# Altium schematic sheet ffultra_p2_pre-channel.SchDoc
size A4; SheetNumber: 11; SheetTotal: 12
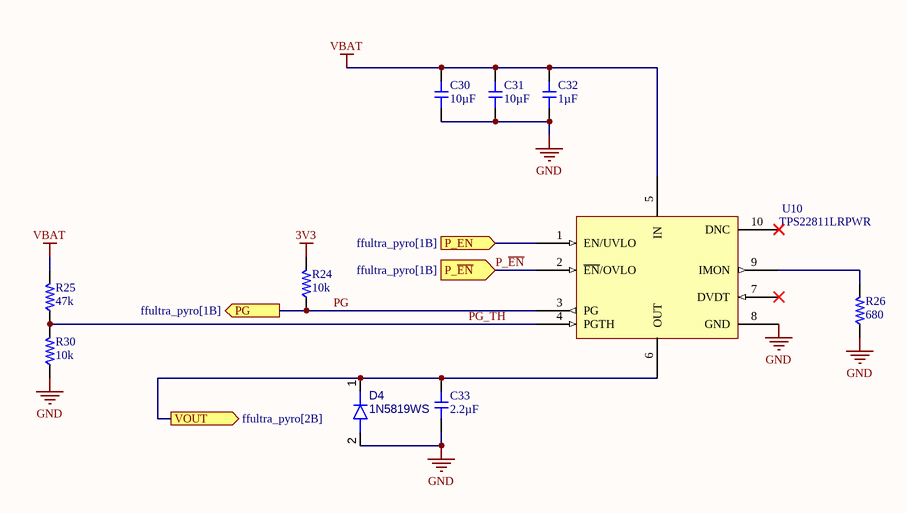
[diagram p0: ffultra_p2_pre-channel.SchDoc]

## Parts
C30  value 10µF  [CAP-0402]  (hidden comment: GRM155R61A106ME44D)
C31  value 10µF  [CAP-0402]  (hidden comment: GRM155R61A106ME44D)
C32  value 1µF  [CAP-0402]  (hidden comment: CL05A105KA5NQNC)
C33  value 2.2µF  [CAP-0402]  (hidden comment: CL05A225MQ5NSNC)
D4  1N5819WS  [FP-477-02-IPC_C]
R24  value 10k  [RES-0402]  (hidden comment: 0402WGF1002TCE)
R25  value 47k  [RES-0402]  (hidden comment: 0402WGF4702TCE)
R26  value 680  [RES-0402]  (hidden comment: 0402WGF6800TCE)
R30  value 10k  [RES-0402]  (hidden comment: 0402WGF1002TCE)
U10  TPS22811LRPWR  [TPS22811LRPWR-Footprint-1]

## Ports
P_EN (in, see ffultra_pyro[1B]), P_~{EN} (in, see ffultra_pyro[1B]), PG (out, see ffultra_pyro[1B]), VOUT (out, see ffultra_pyro[2B])

## Nets
3V3: R24.2
GND: C30.2 C31.2 C32.1 C33.1 D4.2(A) R26.1 R30.1 U10.8(GND)
VBAT: C30.1 C31.1 C32.2 R25.2 U10.5(IN)
P_~{EN}: U10.2(~{EN}/OVLO) ; port P_~{EN}
P_EN: U10.1(EN/UVLO) ; port P_EN
PG: R24.1 U10.3(PG) ; port PG
PG_TH: R25.1 R30.2 U10.4(PGTH)
VOUT: C33.2 D4.1(K) U10.6(OUT) ; port VOUT
NetR26_2: R26.2 U10.9(IMON)

Not connected (* = marked no-connect by the designer): U10 7(DVDT)* 10(DNC)*

## Library data of the parts
C30 C31 = CMP-001-01770-1: Capacitor, Ceramic (MLCC), 10uF, ±20%, 10V, X5R, ±20%, SMD 0402; Manufacturer: Murata Electronics; Manufacturer Part Number: GRM155R61A106ME44D; ComponentLink3URL: https://lcsc.com/product-detail/Multilayer-Ceramic-Capacitors-MLCC---SMD-SMT_Murata-Electronics-Murata-Electronics-GRM155R61A106ME44D_C77000.html; Case/Package: 0402; Category: Capacitors - MLCC; Design Item ID: GRM155R61A106ME44D; JLCPCB Part Number: C77000; Source: jlcpcb_capacitors_extended_0402.schlib; ComponentLink2URL: https://jlcpcb.com/partdetail/C77000; Temperature Coefficient: X5R; ComponentLink3Description: LCSC Part URL; Tolerance: 20%; RoHS: Yes; JLCPCB Basic Part: No; ComponentLink2Description: JLCPCB Part URL; Voltage Rating: 10V; ComponentLink1Description: Datasheet; ComponentLink1URL: https://datasheet.lcsc.com/lcsc/1811141510_Murata-Electronics-GRM155R61A106ME44D_C77000.pdf
C32 = CMP-001-00135-1: Capacitor, Ceramic (MLCC), 1uF, ±10%, 25V, X5R, ±10%, SMD 0402; Manufacturer: Samsung Electro-Mechanics; Voltage Rating: 25V; RoHS: Yes; Temperature Coefficient: X5R; Tolerance: 10%; Source: jlcpcb_capacitors_basic.schlib; ComponentLink1URL: https://datasheet.lcsc.com/lcsc/1811091611_Samsung-Electro-Mechanics-CL05A105KA5NQNC_C52923.pdf; JLCPCB Basic Part: Yes; ComponentLink1Description: Datasheet; ComponentLink2URL: https://jlcpcb.com/partdetail/C52923; Case/Package: 0402; ComponentLink3Description: LCSC Part URL; Manufacturer Part Number: CL05A105KA5NQNC; ComponentLink3URL: https://lcsc.com/product-detail/Multilayer-Ceramic-Capacitors-MLCC---SMD-SMT_Samsung-Electro-Mechanics-Samsung-Electro-Mechanics-CL05A105KA5NQNC_C52923.html; Design Item ID: CL05A105KA5NQNC; JLCPCB Part Number: C52923; ComponentLink2Description: JLCPCB Part URL; Category: Capacitors - MLCC
C33 = CMP-001-00137-1: Capacitor, Ceramic (MLCC), 2.2uF, ±20%, 6.3V, X5R, ±20%, SMD 0402; Manufacturer: Samsung Electro-Mechanics; Voltage Rating: 6.3V; ComponentLink3Description: LCSC Part URL; JLCPCB Basic Part: Yes; JLCPCB Part Number: C12530; ComponentLink1URL: https://datasheet.lcsc.com/lcsc/1811021410_Samsung-Electro-Mechanics-CL05A225MQ5NSNC_C12530.pdf; Tolerance: 20%; Category: Capacitors - MLCC; Source: jlcpcb_capacitors_basic.schlib; ComponentLink2URL: https://jlcpcb.com/partdetail/C12530; ComponentLink3URL: https://lcsc.com/product-detail/Multilayer-Ceramic-Capacitors-MLCC---SMD-SMT_Samsung-Electro-Mechanics-Samsung-Electro-Mechanics-CL05A225MQ5NSNC_C12530.html; ComponentLink2Description: JLCPCB Part URL; Manufacturer Part Number: CL05A225MQ5NSNC; Temperature Coefficient: X5R; RoHS: Yes; ComponentLink1Description: Datasheet; Design Item ID: CL05A225MQ5NSNC; Case/Package: 0402
D4 = CMP-004-00036-1: 40V 600mV@1A 1A SOD-323  Schottky Barrier Diodes (SBD) ROHS; JLCPCB Part Number: C191023
R24 R30 = CMP-009-00191-1: Resistor, 10kΩ, ±1%, 62.5mW, 50V, ±100ppm/℃, -55℃~+155℃, SMD 0402; Manufacturer: Uniroyal; Temperature Rating: -55℃~+155℃; ComponentLink1URL: https://datasheet.lcsc.com/lcsc/2206010100_UNI-ROYAL-Uniroyal-Elec-0402WGF1002TCE_C25744.pdf; Source: jlcpcb_resistors_basic.schlib; Tolerance: 1%; Design Item ID: 0402WGF1002TCE; ComponentLink1Description: Datasheet; ComponentLink2URL: https://jlcpcb.com/partdetail/C25744; Category: Resistors; JLCPCB Part Number: C25744; ComponentLink2Description: JLCPCB Part URL; Temperature Coefficient: ±100ppm/℃; JLCPCB Basic Part: Yes; Power Rating: 62.5mW; Case/Package: 0402; Voltage Rating: 50V; Manufacturer Part Number: 0402WGF1002TCE
R25 = CMP-009-00229-1: Resistor, 47kΩ, ±1%, 62.5mW, 50V, ±100ppm/℃, -55℃~+155℃, SMD 0402; Manufacturer: Uniroyal; Voltage Rating: 50V; ComponentLink2URL: https://jlcpcb.com/partdetail/C25792; ComponentLink1Description: Datasheet; Design Item ID: 0402WGF4702TCE; JLCPCB Part Number: C25792; Tolerance: 1%; Power Rating: 62.5mW; Temperature Coefficient: ±100ppm/℃; Temperature Rating: -55℃~+155℃; ComponentLink2Description: JLCPCB Part URL; Source: jlcpcb_resistors_basic.schlib; Case/Package: 0402; ComponentLink1URL: https://datasheet.lcsc.com/lcsc/2206010100_UNI-ROYAL-Uniroyal-Elec-0402WGF4702TCE_C25792.pdf; JLCPCB Basic Part: Yes; Manufacturer Part Number: 0402WGF4702TCE; Category: Resistors
R26 = CMP-009-00241-1: Resistor, 680Ω, ±1%, 62.5mW, 50V, ±100ppm/℃, -55℃~+155℃, SMD 0402; Manufacturer: Uniroyal; ComponentLink1Description: Datasheet; ComponentLink1URL: https://datasheet.lcsc.com/lcsc/2205311900_UNI-ROYAL-Uniroyal-Elec-0402WGF6800TCE_C25130.pdf; Temperature Rating: -55℃~+155℃; Category: Resistors; Source: jlcpcb_resistors_basic.schlib; Power Rating: 62.5mW; JLCPCB Part Number: C25130; Voltage Rating: 50V; ComponentLink2Description: JLCPCB Part URL; Tolerance: 1%; Manufacturer Part Number: 0402WGF6800TCE; Temperature Coefficient: ±100ppm/℃; JLCPCB Basic Part: Yes; Case/Package: 0402; Design Item ID: 0402WGF6800TCE; ComponentLink2URL: https://jlcpcb.com/partdetail/C25130
U10 = CMP-019-00060-6: 2.7-V to 16-V, 10-A, 6-mΩ load switch with fast overvoltage protection and current monitoring 10-VQFN-HR -40 to 125; JLCPCB Part Number: C17294173